# Altium schematic sheet DIAL_Sheet.SchDoc
size 420 x 297 mm; SheetNumber: 7; SheetTotal: 12
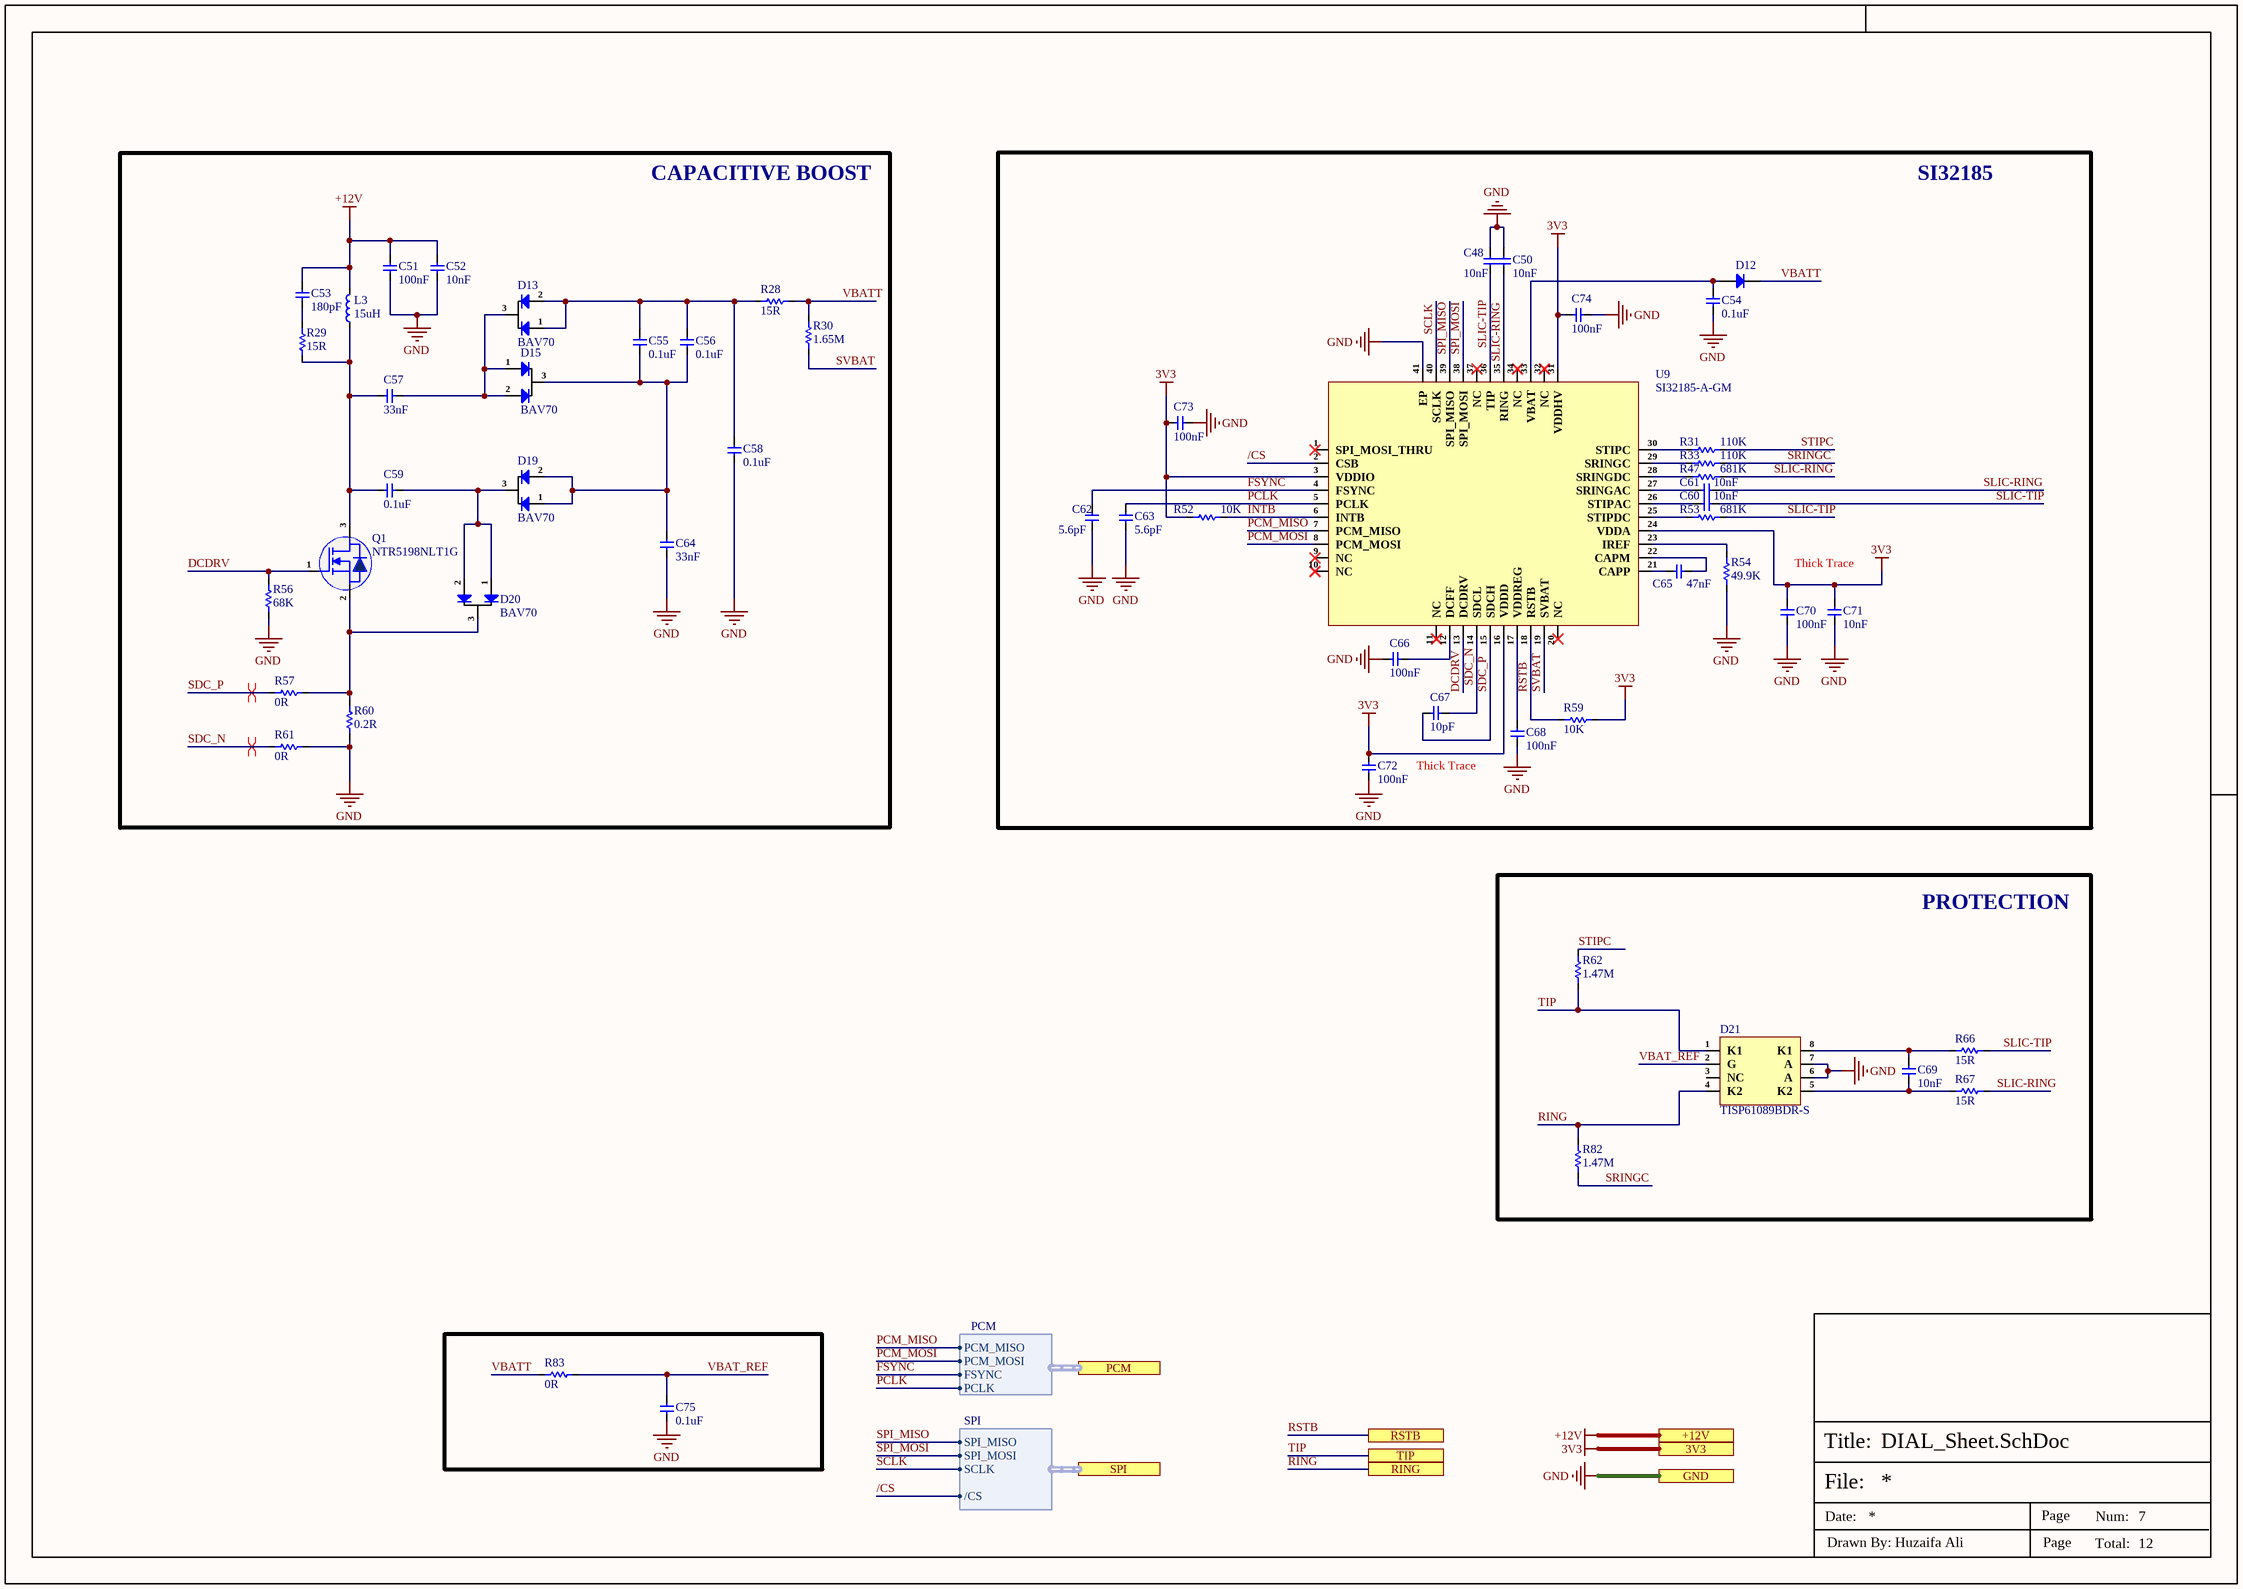
[diagram p0: DIAL_Sheet.SchDoc]

## Parts
C48  10nF  [Cap-0402]
C50  10nF  [Cap-0402]
C51  100nF  [CAP-0201]
C52  10nF  [Cap-0402]
C53  180pF  [CAP-0201]
C54  0.1uF  [Cap-0402]
C55  0.1uF  [Cap-0603]
C56  0.1uF  [Cap-0603]
C57  33nF  [Cap-0805]
C58  0.1uF  [Cap-0805]
C59  0.1uF  [Cap-0805]
C60  10nF  [Cap-0402]
C61  10nF  [Cap-0402]
C62  5.6pF  [Cap-0402]
C63  5.6pF  [Cap-0402]
C64  33nF  [Cap-0805]
C65  47nF  [Cap-0402]
C66  100nF  [CAP-0201]
C67  10pF  [Cap-0402]
C68  100nF  [CAP-0201]
C69  10nF  [Cap-0805]
C70  100nF  [CAP-0201]
C71  10nF  [Cap-0402]
C72  100nF  [CAP-0201]
C73  100nF  [CAP-0201]
C74  100nF  [CAP-0201]
C75  0.1uF  [Cap-0805]
D12  LBAS21HT1G  [SOD-323]  (value not drawn)
D13  BAV70  [SOT-23]
D15  BAV70  [SOT-23]
D19  BAV70  [SOT-23]
D20  BAV70  [SOT-23]
D21  TISP61089BDR-S  [SOIC-8(0.154", 3.90mm Width)]
L3  15uH  [VLS6045AF-150M]
Q1  NTR5198NLT1G  [SOT-23]
R28  15R  [Res-0603]
R29  15R  [Res-0603]
R30  1.65M  [RES-0805]
R31  110K  [Res-0603]
R33  110K  [Res-0603]
R47  681K  [Res-0603]
R52  10K  [Res-0201]
R53  681K  [Res-0603]
R54  49.9K  [Res-0402]
R56  68K  [RES-0603]
R57  0R  [Res-0603]
R59  10K  [Res-0201]
R60  0.2R  [Res-1206]
R61  0R  [Res-0603]
R62  1.47M  [Res-1206]
R66  15R  [Res-0603]
R67  15R  [Res-0603]
R82  1.47M  [Res-1206]
R83  0R  [Res-0603]
U9  SI32185-A-GM  [40-QFN (6x6)]

## Blocks framed on the sheet
CAPACITIVE BOOST: C51-C53 C55-C59 C64 D13 D15 D19 D20 L3 Q1 R28-R30 R56 R57 R60 R61
SI32185: C48 C50 C54 C60-C63 C65-C68 C70-C74 D12 R31 R33 R47 R52-R54 R59 U9
PROTECTION: C69 D21 R62 R66 R67 R82

## Ports
3V3, +12V, GND, PCM (harness PCM), RING, RSTB, SPI (harness SPI), TIP

## Harnesses
SPI: SPI_MISO, SPI_MOSI, SCLK, /CS
PCM: PCM_MISO, PCM_MOSI, FSYNC, PCLK

## Nets
3V3: C70.2 C71.2 C72.2 C73.2 C74.2 R52.1 R59.1 U9.3(VDDIO) U9.16(VDDD) U9.24(VDDA) U9.31(VDDHV) ; port 3V3
+12V: C51.2 C52.2 C53.2 L3.2 ; port +12V
GND: C48.2 C50.2 C51.1 C52.1 C54.2 C58.1 C62.1 C63.1 C64.1 C66.1 C68.1 C70.1 C71.1 C72.1 C73.1 C74.1 C75.1 D21.6(A) D21.7(A) R54.1 R56.1 R60.1 R61.2 U9.41(EP) ; port GND
/CS: U9.2(CSB) ; port SPI./CS
DCDRV: Q1.1(G) R56.2 U9.13(DCDRV)
FSYNC: C62.2 U9.4(FSYNC) ; port PCM.FSYNC
INTB: R52.2 U9.6(INTB)
PCLK: C63.2 U9.5(PCLK) ; port PCM.PCLK
PCM_MISO: U9.7(PCM_MISO) ; port PCM.PCM_MISO
PCM_MOSI: U9.8(PCM_MOSI) ; port PCM.PCM_MOSI
RING: D21.4(K2) R82.2 ; port RING
RSTB: R59.2 U9.18(RSTB) ; port RSTB
SCLK: U9.40(SCLK) ; port SPI.SCLK
SDC_N: C67.2 R61.1 U9.14(SDCL)
SDC_P: C67.1 R57.1 U9.15(SDCH)
SLIC-RING: C50.1 C61.1 R47.2 R67.2 U9.35(RING)
SLIC-TIP: C48.1 C60.1 R53.2 R66.2 U9.36(TIP)
SPI_MISO: U9.39(SPI_MISO) ; port SPI.SPI_MISO
SPI_MOSI: U9.38(SPI_MOSI) ; port SPI.SPI_MOSI
SRINGC: R33.2 R82.1
STIPC: R31.2 R62.2
SVBAT: R30.1 U9.19(SVBAT)
TIP: D21.1(K1) R62.1 ; port TIP
VBAT_REF: C75.2 D21.2(G) R83.2
VBATT: D12.1(K) R28.2 R30.2 R83.1
NetC53_1: C53.1 R29.2
NetC54_1: C54.1 D12.2(A) U9.33(VBAT)
NetC55_1: C55.1 C56.1 C64.2 D15.3 D19.1 D19.2
NetC55_2: C55.2 C56.2 C58.2 D13.1 D13.2 R28.1
NetC57_1: C57.1 C59.1 L3.1 Q1.3(D) R29.1
NetC57_2: C57.2 D13.3 D15.1 D15.2
NetC59_2: C59.2 D19.3 D20.1 D20.2
NetC60_2: C60.2 U9.26(STIPAC)
NetC61_2: C61.2 U9.27(SRINGAC)
NetC65_1: C65.1 U9.21(CAPP)
NetC65_2: C65.2 U9.22(CAPM)
NetC66_2: C66.2 U9.12(DCFF)
NetC68_2: C68.2 U9.17(VDDREG)
NetC69_1: C69.1 D21.5(K2) R67.1
NetC69_2: C69.2 D21.8(K1) R66.1
NetD20_3: D20.3 Q1.2(S) R57.2 R60.2
NetR31_1: R31.1 U9.30(STIPC)
NetR33_1: R33.1 U9.29(SRINGC)
NetR47_1: R47.1 U9.28(SRINGDC)
NetR53_1: R53.1 U9.25(STIPDC)
NetR54_2: R54.2 U9.23(IREF)

Not connected (* = marked no-connect by the designer): D21 3(NC); U9 1(SPI_MOSI_THRU)* 9(NC)* 10(NC)* 11(NC)* 20(NC)* 32(NC)* 34(NC)* 37(NC)*

## Layout directives
differential pair; net class SDC; differential pair class SDC_LINES: SDC_N, SDC_P

## Notes on the sheet
- Thick Trace
- File:
- Title:
- Date:
- Page
- Num:
- Total:
- Drawn By: Huzaifa Ali

## Library data of the parts
C48 C50 C52 C60 C61 C71 = GCM155R71H103JA55D: CAP CER 10000PF 50V X7R 0402; Manufacturer: Murata; Tolerance: 5%; Item Type: Capacitor; Supplier: Digikey; Supplier Part Number: 490-14352-2-ND; Manufacturer Part Number: GCM155R71H103JA55D; RoHS: Yes; Category: Ceramic Capacitors; Mounting Technology: Surface Mount; Case/Package: 0402; Case Code (Imperial): 0402; Case Code (Metric): 1005; Min Operating Temperature: -55°C; Max Operating Temperature: 125°C; Packaging: Cut Tape; Value: 10nF; Voltage Rating: 50V; Series: GCM; Ratings: AEC-Q200; RoHS Compliant: Yes; ComponentLink1URL: http://search.murata.co.jp/Ceramy/image/img/A01X/partnumbering_e_02.pdf?src-supplier=Digikey; ComponentLink1Description: http://search.murata.co.jp/Ceramy/image/img/A01X/partnumbering_e_02.pdf?src-supplier=Digikey; ComponentLink2URL: http://search.murata.co.jp/Ceramy/image/img/A01X/G101/ENG/GCM155R71H103JA55-01.pdf?src-supplier=Digikey; ComponentLink2Description: http://search.murata.co.jp/Ceramy/image/img/A01X/G101/ENG/GCM155R71H103JA55-01.pdf?src-supplier=Digikey; LCSC Part Number: C5189696
C51 C66 C68 C70 C72-C74 = CC0201KRX5R6BB104: CAP CER 0.1UF 10V X5R 0201; Manufacturer: Yageo; Tolerance: 10%; Supplier 1: Mouser; Manufacturer Part Number: CC0201KRX5R6BB104; RoHS: Yes; Category: Ceramic Capacitors; Stock 1: 824403; Pricing 1: 1=0.10000, 10=0.02400, 50=0.02400, 100=0.01900, 1000=0.01100, 10000=0.00900 (USD); Mount: Surface Mount; Case/Package: 0201; Case Code (Imperial): 0201; Case Code (Metric): 0603; Weight: 6E-06oz; Min Operating Temperature: -55°C; Max Operating Temperature: 85°C; Capacitance: 100nF; Dielectric: X5R; Voltage Rating (DC): 10V; Packaging: Tape and Reel; Termination: SMD/SMT; Resistor Type: Ceramic; Voltage Rating: 10V; Series: CC; Construction: Flat; Length: 0.6mm; Width: 0.012inch; Height: 0.3mm; Thickness: 0.013inch; Depth: 0.3mm; Radiation Hardening: No; Lead Free: Lead Free; Halogen Free: Halogen Free; RoHS Compliant: Yes; ComponentLink1URL: https://datasheet.ciiva.com/11587/upy-gphc-x5r-4v-to-50v-12-11587190.pdf?src-supplier=Avnet; ComponentLink1Description: https://datasheet.ciiva.com/11587/upy-gphc-x5r-4v-to-50v-12-11587190.pdf?src-supplier=Avnet; Supplier Part Number 1: 603-CC201KRX5R6BB104; LCSC Part Number: C190183
C53 = 0201B181J500CT: CAP CER 180PF 50V X7R 0201; Manufacturer: Walsin Technologies; Item Type: Capacitor; Supplier: Digikey; Supplier Part Number: 1292-0201B181J500CTTR-ND; Manufacturer Part Number: 0201B181J500CT; RoHS: Yes; Category: Ceramic Capacitors; Pricing: 15000=0.0101 (USD); RoHS Compliant: Yes; LCSC Part Number: C458606
C54 = C1005X5R1H104K050BB: CAP CER 0.1UF 50V X5R 0402; Manufacturer: TDK; Dielectric Material: Ceramic; Capacitance: 100nF; Tolerance: 10%; Item Type: Capacitor; Supplier 1: Digi-Key; Manufacturer Part Number: C1005X5R1H104K050BB; Stock 1: 1455182; Pricing 1: 1=0.12, 10=0.09, 50=0.049, 100=0.04, 500=0.02858, 1000=0.02245, 2500=0.02041, 5000=0.01878 (USD); Mount: Surface Mount; Case/Package: 0402; Case Code (Metric): 1005; Case Code (Imperial): 0402; Weight: 2.3E-05oz; Min Operating Temperature: -55°C; Max Operating Temperature: 85°C; Dielectric: X5R; Voltage Rating: 50V; Packaging: Tape and Reel; Voltage Rating (DC): 50V; Termination: SMD/SMT; Construction: Flat; Package Quantity: 1; Resistor Type: Ceramic; Voltage: 50V; Series: C; Length: 1mm; Width: 0.02inch; Height: 0.5mm; Depth: 0.5mm; Thickness: 0.022inch; Radiation Hardening: No; Lead Free: Lead Free; REACH SVHC: No SVHC; RoHS Compliant: Yes; ComponentLink1URL: https://product.tdk.com/info/en/catalog/spec/mlccspec_commercial_general_midvoltage_en.pdf?src-supplier=Digi-Key; ComponentLink1Description: https://product.tdk.com/info/en/catalog/spec/mlccspec_commercial_general_midvoltage_en.pdf?src-supplier=Digi-Key; ComponentLink2URL: http://www.tdk.co.jp/tefe02/e413_c.pdf?src-supplier=Future+Electronics; ComponentLink2Description: http://www.tdk.co.jp/tefe02/e413_c.pdf?src-supplier=Future+Electronics; ComponentLink3URL: https://www.verical.com/server-webapp/html/getDatasheet?partID=743571&src-supplier=Verical; ComponentLink3Description: https://www.verical.com/server-webapp/html/getDatasheet?partID=743571&src-supplier=Verical; ComponentLink4URL: http://www.tdk.co.jp/tefe02/e412_c.pdf?src-supplier=Avnet+Europe; ComponentLink4Description: http://www.tdk.co.jp/tefe02/e412_c.pdf?src-supplier=Avnet+Europe; Supplier Part Number 1: 445-5942-1-ND; LCSC Part Number: C2181865
C55 C56 = CC0603KRX7R0BB104: CAP CER 0.1UF 100V X7R 0603; Manufacturer: Yageo; Capacitance: 100nF; Tolerance: 10%; Item Type: Capacitor; Supplier 1: Digi-Key; Manufacturer Part Number: CC0603KRX7R0BB104; RoHS: Yes; Category: Ceramic Capacitors; Stock 1: 60476; Pricing 1: 1=0.19000, 10=0.13500, 50=0.07680, 100=0.06370, 500=0.04466, 1000=0.03696 (USD); Mount: Surface Mount; Case/Package: 0603; Case Code (Metric): 1608; Case Code (Imperial): 0603; Weight: 7.1E-05oz; Min Operating Temperature: -55°C; Max Operating Temperature: 125°C; Package Quantity: 4000; Voltage Rating: 100V; Packaging: Tape and Reel; Dielectric: X7R; Termination: SMD/SMT; Resistor Type: Ceramic; Voltage Rating (DC): 100V; Series: CC; Length: 0.063inch; Width: 0.031inch; Thickness: 0.035inch; Depth: 0.8mm; Lead Free: Lead Free; RoHS Compliant: Yes; ComponentLink1URL: https://datasheet.ciiva.com/6277/mlccorderingcode-6277030.pdf?src-supplier=Digi-Key; ComponentLink1Description: https://datasheet.ciiva.com/6277/mlccorderingcode-6277030.pdf?src-supplier=Digi-Key; ComponentLink2URL: https://datasheet.ciiva.com/6277/mlccorderingcode-6277081.pdf?src-supplier=Digi-Key; ComponentLink2Description: https://datasheet.ciiva.com/6277/mlccorderingcode-6277081.pdf?src-supplier=Digi-Key; ComponentLink3URL: https://datasheet.ciiva.com/6277/mlccorderingcode-6277082.pdf?src-supplier=Digi-Key; ComponentLink3Description: https://datasheet.ciiva.com/6277/mlccorderingcode-6277082.pdf?src-supplier=Digi-Key; Supplier Part Number 1: 311-1523-1-ND; LCSC Part Number: C113803
C57 C64 = HHV0805R7333K251NSLJ: 250V 33nF X7R 0805 Multilayer Ceramic Capacitors MLCC - SMD/SMT ROHS; Manufacturer: Chinocera; Manufacturer Part Number: HHV0805R7333K251NSLJ; Package: 0805; LCSC Part Number: C5186797; Item Type: Capacitor; ComponentLink1Description: LCSC; ComponentLink1URL: https://www.lcsc.com/product-detail/Multilayer-Ceramic-Capacitors-MLCC-SMD-SMT_Chinocera-HHV0805R7333K251NSLJ_C5186797.html
C58 C59 C75 = C2012X7T2E104KT000N: CAP CER 0.1UF 250V X7T 0805; Manufacturer: TDK Corporation; Manufacturer Part Number: C2012X7T2E104K125AA; Item Type: Capacitor; Package: 0805; LCSC Part Number: C342865; ComponentLink1Description: LCSC; ComponentLink1URL: https://www.lcsc.com/product-detail/Multilayer-Ceramic-Capacitors-MLCC-SMD-SMT_TDK-C2012X7T2E104KT000N_C342865.html
C62 C63 = CC0402BRNPO9BN5R6: CAP CER 5.6PF 50V C0G/NPO 0402; Manufacturer: Yageo; Item Type: Capacitor; Supplier: Future Electronics; Supplier Part Number: 3807997; Manufacturer Part Number: CC0402BRNPO9BN5R6; RoHS: Yes; Category: Ceramic Capacitors; Stock: 1840000; Pricing: 10000=0.0035, 40000=0.0031, 50000=0.0033, 150000=0.003, 250000=0.0031, 300000=0.0029, 500000=0.003, 750000=0.0027, 1500000=0.0028 (USD); Halogen Free: 5694HalogenFree; ComponentLink1URL: https://datasheet.ciiva.com/26829/getdatasheetpartid-403430-26829253.pdf?src-supplier=Verical; ComponentLink1Description: https://datasheet.ciiva.com/26829/getdatasheetpartid-403430-26829253.pdf?src-supplier=Verical; ComponentLink2URL: https://datasheet.ciiva.com/13265/upy-gp-np0-16v-to-50v-8-3714-13265516.pdf?src-supplier=Mouser; ComponentLink2Description: https://datasheet.ciiva.com/13265/upy-gp-np0-16v-to-50v-8-3714-13265516.pdf?src-supplier=Mouser; LCSC Part Number: C505468
C65 = CC0402KRX7R9BB473: CAP CER 0.047UF 50V X7R 0402; Manufacturer: Yageo; Material: 4241ConductorMaterial; Tolerance: 10%; Temperature Coefficient: 30ppm/°C; Dielectric: 1511DielectricType; Item Type: Capacitor; Supplier: Future Electronics; Supplier Part Number: 2095687; Manufacturer Part Number: CC0402KRX7R9BB473; RoHS: Yes; Category: Ceramic Capacitors; Stock: 1130000; Pricing: 10000=0.0044, 40000=0.0042, 100000=0.004, 150000=0.0041, 250000=0.0039, 400000=0.0037, 500000=0.0038 (USD); Mounting Technology: Surface Mount; Case/Package: 0402; Case Code (Imperial): 0402; Case Code (Metric): 1005; Min Operating Temperature: -55°C; Max Operating Temperature: 125°C; Packaging: Tape and Reel; Value: 47nF; Voltage Rating: 50V; Series: CC; Voltage Rating (DC): 50V; Length: 0.039inch; Width: 0.02inch; Height: 550um; Thickness: 0.022inch; RoHS Compliant: Yes; Halogen Free: 5694HalogenFree; Lead Free: 5697LeadFree; ComponentLink1URL: https://datasheet.octopart.com/CC0402KRX7R9BB473-Yageo-datasheet-166511530.pdf?src-supplier=Future+Electronics; ComponentLink1Description: https://datasheet.octopart.com/CC0402KRX7R9BB473-Yageo-datasheet-166511530.pdf?src-supplier=Future+Electronics; ComponentLink2URL: http://www.yageo.com/documents/recent/UPY-GPHC_X7R_6.3V-to-50V_18.pdf?src-supplier=Digikey; ComponentLink2Description: http://www.yageo.com/documents/recent/UPY-GPHC_X7R_6.3V-to-50V_18.pdf?src-supplier=Digikey; ComponentLink3URL: https://datasheet.octopart.com/CC0402KRX7R9BB473-Yageo-datasheet-140260305.pdf?src-supplier=Newark; ComponentLink3Description: https://datasheet.octopart.com/CC0402KRX7R9BB473-Yageo-datasheet-140260305.pdf?src-supplier=Newark; LCSC Part Number: C272875
C67 = GRM1555C1H100JA01D: CAP CER 10PF 50V C0G/NP0 0402; Manufacturer: Murata; Material: Ceramic; Dielectric: C0G; Tolerance: 5%; Item Type: Capacitor; Supplier: Arrow Electronics; Supplier Part Number: GRM1555C1H100JA01D; Manufacturer Part Number: GRM1555C1H100JA01D; RoHS: Yes; Category: Ceramic Capacitors; Stock: 3860000; Pricing: 10000=0.0034, 50000=0.0027, 100000=0.0023, 250000=0.0021 (USD); Mounting Technology: Surface Mount; Case/Package: 0402; Case Code (Metric): 1005; Case Code (Imperial): 0402; Min Operating Temperature: -55°C; Max Operating Temperature: 125°C; Value: 10pF; Voltage Rating: 50V; Packaging: Tape and Reel; Package Quantity: 1; Voltage Rating (DC): 50V; Termination: SMD/SMT; Series: GRM; Voltage: 50V; Construction: Flat; Length: 1mm; Width: 0.02inch; Height: 0.5mm; Depth: 0.5mm; Thickness: 0.022inch; Radiation Hardening: No; RoHS Compliant: Yes; Lead Free: Lead Free; Reach SVHC Compliant: No; ComponentLink1URL: https://datasheet.ciiva.com/2989/product-2989280.pdf?src-supplier=Avnet; ComponentLink1Description: https://datasheet.ciiva.com/2989/product-2989280.pdf?src-supplier=Avnet; ComponentLink2URL: https://datasheet.ciiva.com/18184/getdatasheetpartid-307234-18184164.pdf?src-supplier=Verical; ComponentLink2Description: https://datasheet.ciiva.com/18184/getdatasheetpartid-307234-18184164.pdf?src-supplier=Verical; ComponentLink3URL: https://datasheet.ciiva.com/29200/453545-da-01-en-vs-kondensator-0402-29200107.pdf?src-supplier=Conrad; ComponentLink3Description: https://datasheet.ciiva.com/29200/453545-da-01-en-vs-kondensator-0402-29200107.pdf?src-supplier=Conrad; ComponentLink4URL: https://datasheet.ciiva.com/7828/1666664-7828812.pdf?src-supplier=Element14; ComponentLink4Description: https://datasheet.ciiva.com/7828/1666664-7828812.pdf?src-supplier=Element14; ComponentLink5URL: https://datasheet.ciiva.com/6271/partnumbering-e-01-6271159.pdf?src-supplier=Digi-Key; ComponentLink5Description: https://datasheet.ciiva.com/6271/partnumbering-e-01-6271159.pdf?src-supplier=Digi-Key; ComponentLink6URL: https://datasheet.ciiva.com/6271/partnumbering-e-01-6271158.pdf?src-supplier=Digi-Key; ComponentLink6Description: https://datasheet.ciiva.com/6271/partnumbering-e-01-6271158.pdf?src-supplier=Digi-Key; ComponentLink7URL: https://datasheet.ciiva.com/6271/partnumbering-e-01-6271068.pdf?src-supplier=Digi-Key; ComponentLink7Description: https://datasheet.ciiva.com/6271/partnumbering-e-01-6271068.pdf?src-supplier=Digi-Key; LCSC Part Number: C76946
C69 = 0805B103J201CT: CAP CER 10000PF 200V X7R 0805; Manufacturer: Walsin Technology Corporation; Item Type: Capacitor; Manufacturer Part Number: 0805B103J201CT; Package: 0805; LCSC Part Number: C5122275; ComponentLink1Description: LCSC; ComponentLink1URL: https://www.lcsc.com/product-detail/Multilayer-Ceramic-Capacitors-MLCC-SMD-SMT_Walsin-Tech-Corp-0805B103J201CT_C5122275.html
D12 = LBAS21HT1G: 250V 200mW Single 1.25V 50ns 200mA SOD-323 Switching Diode ROHS; Manufacturer: LRC; Manufacturer Part Number: LBAS21HT1G; Package: SOD-323; LCSC Part Number: C12742; Item Type: Diode; ComponentLink1Description: LCSC; ComponentLink1URL: https://www.lcsc.com/product-detail/Switching-Diode_LRC-LBAS21HT1G_C12742.html
D13 D15 D19 D20 = BAV70: 70V 225mW Dual Common Cathode 1.25V@150mA 6ns 200mA SOT-23 Switching Diode ROHS; Manufacturer: TWGMC; Manufacturer Part Number: BAV70; Package: SOT-23; LCSC Part Number: C727123; Item Type: Diode; ComponentLink1Description: LCSC; ComponentLink1URL: https://www.lcsc.com/product-detail/Switching-Diode_TWGMC-BAV70_C727123.html
D21 = TISP61089BDR-S: THYRISTOR 170V 30A 8SOIC; Manufacturer: Bourns; Number of Elements: 2; Value: 100pF; Forward Voltage: 3V; Hold Current: 150mA; Current Rating: -5uA; Item Type: (TVS/ESD); Supplier: Digikey; Supplier Part Number: TISP61089BDR-SCT-ND; Manufacturer Part Number: TISP61089BDR-S; RoHS: Yes; Category: TRIACs; Stock: 22616; Pricing: 1=1.38, 10=1.129, 100=0.8781, 500=0.74428, 1000=0.6063 (USD); Mounting Technology: Surface Mount; Case/Package: SOIC; Pins: 8; Weight: 0.004762oz; Min Operating Temperature: -40°C; Max Operating Temperature: 85°C; Packaging: Tape and Reel; Package Quantity: 2500; Max Repetitive Reverse Voltage (Vrrm): 170V; Number of Circuits: 2; Peak Pulse Current: 30A; Operating Supply Voltage: 3V; Series: -; Length: 5mm; Width: 4mm; Height: 1.55mm; Radiation Hardening: No; Reach SVHC Compliant: No; Lead Free: Lead Free; RoHS Compliant: Yes; ComponentLink1URL: https://datasheet.ciiva.com/30076/tisp61089b-30076825.pdf?src-supplier=Onlinecomponents.com; ComponentLink1Description: https://datasheet.ciiva.com/30076/tisp61089b-30076825.pdf?src-supplier=Onlinecomponents.com; ComponentLink2URL: https://datasheet.ciiva.com/46364/2035135-46364842.pdf?src-supplier=Jameco; ComponentLink2Description: https://datasheet.ciiva.com/46364/2035135-46364842.pdf?src-supplier=Jameco; ComponentLink3URL: https://datasheet.ciiva.com/4744/tisp61089b-75813-4744776.pdf?src-supplier=Mouser; ComponentLink3Description: https://datasheet.ciiva.com/4744/tisp61089b-75813-4744776.pdf?src-supplier=Mouser; ComponentLink4URL: https://datasheet.ciiva.com/362/tisp61089b-362311.pdf?src-supplier=Digikey; ComponentLink4Description: https://datasheet.ciiva.com/362/tisp61089b-362311.pdf?src-supplier=Digikey; LCSC Part Number: C415877
L3 = VLS6045AF-150M: FIXED IND 15UH 2.8A 77 MOHM SMD; Manufacturer: TDK; Core Material: Ferrite; Tolerance: 20%; Saturation Current: 2.5A; Shielding: Shielded; DC Resistance (DCR): 77mR; Test Frequency: 100kHz; Item Type: Inductor; Supplier: Mouser; Supplier Part Number: 810-VLS6045AF-150M; Manufacturer Part Number: VLS6045AF-150M; RoHS: Yes; Category: Fixed Inductors; Stock: 1988; Pricing: 1=0.44, 10=0.415, 50=0.415, 100=0.3, 1000=0.204, 10000=0.185 (USD); Mounting Technology: Surface Mount; Case/Package: Nonstandard; Min Operating Temperature: -40°C; Max Operating Temperature: 105°C; Series: VLS; Packaging: Cut Tape; Value: 15uH; RoHS Compliant: Yes; ComponentLink1URL: https://product.tdk.com/info/en/catalog/datasheets/inductor_commercial_power_vls6045af_en.pdf?src-supplier=Digi-Key; ComponentLink1Description: https://product.tdk.com/info/en/catalog/datasheets/inductor_commercial_power_vls6045af_en.pdf?src-supplier=Digi-Key; LCSC Part Number: C2043078
Q1 = NTR5198NLT1G: SOT-23 MOSFETs ROHS; Manufacturer: TECH PUBLIC; Item Type: MOSFET; Manufacturer Part Number: NTR5198NLT1G; Package: SOT-23; LCSC Part Number: C5122029; ComponentLink1Description: LCSC; ComponentLink1URL: https://www.lcsc.com/product-detail/MOSFETs_TECH-PUBLIC-NTR5198NLT1G_C5122029.html
R28 R29 R66 R67 = RC0603FR-0715RL: RES 15 OHM 1% 1/10W 0603; Manufacturer: Yageo; Voltage Rating (AC): 50V; Current Rating: 50mA; Item Type: Resistor; Supplier: Future Electronics; Supplier Part Number: 6308514; Manufacturer Part Number: RC0603FR-0715RL; RoHS: Yes; Category: Chip SMD Resistors; Stock: 5830000; Pricing: 5000=0.0011, 75000=0.001, 200000=0.001, 500000=0.001, 1250000=0.0009 (USD); Weight: 250mg; Contact Material: 157ConductorMaterial; Lead Free: 5697LeadFree; ComponentLink1URL: https://datasheet.ciiva.com/5989/1686128-5989704.pdf?src-supplier=Farnell; ComponentLink1Description: https://datasheet.ciiva.com/5989/1686128-5989704.pdf?src-supplier=Farnell; ComponentLink2URL: https://datasheet.ciiva.com/8890/pyu-rc0603-51-rohs-l-4-8890742.pdf?src-supplier=Avnet; ComponentLink2Description: https://datasheet.ciiva.com/8890/pyu-rc0603-51-rohs-l-4-8890742.pdf?src-supplier=Avnet; ComponentLink3URL: https://datasheet.ciiva.com/12557/rc0603-272842-12557839.pdf?src-supplier=Mouser; ComponentLink3Description: https://datasheet.ciiva.com/12557/rc0603-272842-12557839.pdf?src-supplier=Mouser; ComponentLink4URL: https://datasheet.ciiva.com/2454/pyu-r-int-thick-7-2454840.pdf?src-supplier=Digikey; ComponentLink4Description: https://datasheet.ciiva.com/2454/pyu-r-int-thick-7-2454840.pdf?src-supplier=Digikey; ComponentLink5URL: https://datasheet.ciiva.com/2454/pyu-r-int-thick-7-2454841.pdf?src-supplier=Digikey; ComponentLink5Description: https://datasheet.ciiva.com/2454/pyu-r-int-thick-7-2454841.pdf?src-supplier=Digikey; ComponentLink6URL: https://datasheet.ciiva.com/2454/pyu-r-int-thick-7-2454842.pdf?src-supplier=Digikey; ComponentLink6Description: https://datasheet.ciiva.com/2454/pyu-r-int-thick-7-2454842.pdf?src-supplier=Digikey; ComponentLink7URL: https://datasheet.ciiva.com/7746/443971-7746262.pdf?src-supplier=Element14; ComponentLink7Description: https://datasheet.ciiva.com/7746/443971-7746262.pdf?src-supplier=Element14; ComponentLink8URL: https://datasheet.ciiva.com/7746/443971-7746263.pdf?src-supplier=Element14; ComponentLink8Description: https://datasheet.ciiva.com/7746/443971-7746263.pdf?src-supplier=Element14; LCSC Part Number: C128059
R30 = SCR0805F1M65: 125mW Thick Film Resistors 150V ±1% 1.65MΩ 0805 Chip Resistor - Surface Mount ROHS; Manufacturer: VO; Manufacturer Part Number: SCR0805F1M65; Package: 0805; LCSC Part Number: C3016615; Item Type: Resistor; ComponentLink1Description: LCSC; ComponentLink1URL: https://www.lcsc.com/product-detail/Chip-Resistor-Surface-Mount_VO-SCR0805F1M65_C3016615.html
R31 R33 = 0603WAD1103T5E: 110kΩ 0603 Chip Resistor - Surface Mount ROHS; Manufacturer: UNI-ROYAL; ComponentLink1Description: LCSC; ComponentLink1URL: https://www.lcsc.com/product-detail/Chip-Resistor-Surface-Mount_UNI-ROYAL-Uniroyal-Elec-0603WAD1103T5E_C423090.html; Manufacturer Part Number: 0603WAD1103T5E; Value: 110K; Footprint: 0603; LCSC Part Number: C423090; Item Type: Resistor
R47 R53 = RT0603BRD07681KL: RES SMD 681K OHM 0.1% 1/10W 0603; Manufacturer: Yageo; Value: 681kR; Power Rating: 100mW; Voltage Rating: 75V; Temperature Coefficient: 25ppm/°C; Item Type: Resistor; Supplier 1: Mouser; Manufacturer Part Number: RT0603BRD07681KL; RoHS: Yes; Category: Chip SMD Resistors; Stock 1: 6293; Pricing 1: 1=0.30000, 10=0.25300, 50=0.25300, 100=0.09900, 1000=0.04200, 10000=0.03400 (USD); Case/Package: 0603; Case Code (Imperial): 0603; Case Code (Metric): 1608; Weight: 7.1E-05oz; Min Operating Temperature: -55°C; Max Operating Temperature: 155°C; Packaging: Tape and Reel; Tolerance: 0.1%; Resistor Type: Thin Film; Number of Terminations: 2; Termination: SMD/SMT; Max Power Dissipation: 100mW; Features: Moisture Resistant; Series: RT; Length: 0.063inch; Width: 0.031inch; Height: 0.022inch; RoHS Compliant: Yes; ComponentLink1URL: https://datasheet.ciiva.com/12800/pyu-rt-1-to-0-05-rohs-l-4-12800173.pdf?src-supplier=Mouser; ComponentLink1Description: https://datasheet.ciiva.com/12800/pyu-rt-1-to-0-05-rohs-l-4-12800173.pdf?src-supplier=Mouser; Supplier Part Number 1: 603-RT0603BRD07681KL; LCSC Part Number: C861520
R52 R59 = RC0201FR-0710KL: RES SMD 10K OHM 1% 1/20W 0201; Manufacturer: Yageo; Item Type: Resistor; Manufacturer Part Number: RC0201FR-0710KL; Package: 0201; ComponentLink7Description: LCSC; ComponentLink7URL: https://www.lcsc.com/product-detail/Chip-Resistor-Surface-Mount_YAGEO-RC0201FR-0710KL_C106225.html; LCSC Part Number: C106225
R54 = RC0402FR-0749K9L: RES 49.9K OHM 1% 1/16W 0402; Manufacturer: Yageo; Power Rating: 62.5mW; Value: 49.9kR; Voltage Rating: 50V; Temperature Coefficient: 100ppm/°C; Max Power Dissipation: 63mW; Item Type: Resistor; Supplier: Digikey; Supplier Part Number: 311-49.9KLRCT-ND; Manufacturer Part Number: RC0402FR-0749K9L; RoHS: Yes; Category: Chip SMD Resistors; Stock: 5084418; Pricing: 1=0.1, 10=0.015, 50=0.0088, 100=0.0073, 500=0.00488, 1000=0.00417, 5000=0.00297 (USD); Case/Package: 0402; Case Code (Imperial): 0402; Case Code (Metric): 1005; Min Operating Temperature: -55°C; Max Operating Temperature: 155°C; Tolerance: 1%; Packaging: Tape and Reel; Termination: SMD/SMT; Voltage Rating (DC): 50V; Features: Moisture Resistant; Series: RC; Number of Terminations: 2; Construction: Rectangular; Length: 1mm; Depth: 0.5mm; RoHS Compliant: Yes; Military Standard: Not; Lead Free: Lead Free; ComponentLink1URL: https://datasheet.ciiva.com/17071/pyu-rc0402-51-rohs-l-6-r-17071066.pdf?src-supplier=Future+Electronics; ComponentLink1Description: https://datasheet.ciiva.com/17071/pyu-rc0402-51-rohs-l-6-r-17071066.pdf?src-supplier=Future+Electronics; LCSC Part Number: C137969
R56 = 0603WAF6802T5E: 100mW Thick Film Resistors 75V ±100ppm/℃ ±1% 68kΩ 0603 Chip Resistor - Surface Mount ROHS; Manufacturer: UNI-ROYAL(Uniroyal Elec); Manufacturer Part Number: 0603WAF6802T5E; Package: 0603; ComponentLink1Description: LCSC; ComponentLink1URL: https://www.lcsc.com/product-detail/Chip-Resistor-Surface-Mount_UNI-ROYAL-Uniroyal-Elec-0603WAF6802T5E_C23231.html; LCSC Part Number: C23231; Item Type: Resistor
R57 R61 R83 = RC0603JR-070RL: RES 0 OHM JUMPER 1/10W 0603; Manufacturer: Yageo; Resistance: 0mR; Tolerance: 1%; Power Rating: 100mW; Voltage Rating (DC): 50V; Temperature Coefficient: 200ppm/°C; Resistance Tolerance: 5%; Item Type: Resistor; Supplier 1: Digi-Key; Manufacturer Part Number: RC0603JR-070RL; RoHS: Yes; Category: Chip SMD Resistors; Stock 1: 18081776; Pricing 1: 1=0.10000, 10=0.01700, 25=0.01240, 50=0.00960, 100=0.00700, 250=0.00536, 500=0.00430, 1000=0.00316 (USD); Case/Package: 0603; Number of Pins: 2; Contact Plating: Tin,Matte; Case Code (Imperial): 0603; Case Code (Metric): 1608; Size Code: 0603; Min Operating Temperature: -55°C; Max Operating Temperature: 155°C; Resistor Type: Thick Film; Packaging: Tape and Reel; Termination: SMD/SMT; Series: RC; Technology: THICK FILM; Package Quantity: 5000; Voltage Rating: 50V; Features: Moisture Resistant; Max Power Dissipation: 100mW; Number of Terminations: 2; Construction: Rectangular; Length: 1.6mm; Width: 0.8mm; Height: 0.45mm; Depth: 0.8mm; Radiation Hardening: No; Reach SVHC Compliant: No SVHC; Lead Free: Lead Free; RoHS Compliant: Yes; Military Standard: Not; Supplier Part Number 1: 311-0.0GRCT-ND; LCSC Part Number: C95177
R60 = PT1206FR-7W0R2L: RES 0.2 OHM 1% 1/2W 1206; Manufacturer: Yageo; Value: 200mR; Max Power Dissipation: 500mW; Temperature Coefficient: 75ppm/°C; Item Type: Resistor; Supplier: Rs; Supplier Part Number: 1996026P; Manufacturer Part Number: PT1206FR-7W0R2L; RoHS: Yes; Category: Chip SMD Resistors; Stock: 1100; Pricing: 100=0.134, 250=0.125, 500=0.117, 1000=0.106 (GBP); Case/Package: 1206; Min Operating Temperature: -55°C; Max Operating Temperature: 155°C; Packaging: Tape and Reel; Number of Terminations: 2; Tolerance: 1%; Features: Moisture Resistant,Automotive AEC-Q200; Series: PT; Length: 0.122inch; Width: 0.063inch; Height: 0.026inch; ComponentLink1URL: http://www.mouser.com/ds/2/447/yageodocoutput-1101729.pdf?src-supplier=Mouser; ComponentLink1Description: http://www.mouser.com/ds/2/447/yageodocoutput-1101729.pdf?src-supplier=Mouser; ComponentLink2URL: http://www.yageo.com/exep/pages/download/literatures/R-chip_current%20sensor_20140512.pdf?src-supplier=Digikey; ComponentLink2Description: http://www.yageo.com/exep/pages/download/literatures/R-chip_current%20sensor_20140512.pdf?src-supplier=Digikey; LCSC Part Number: C309533
R62 R82 = FRC1206F1474TS: 250mW Thick Film Resistors 200V ±100ppm/℃ ±1% 1.47MΩ 1206 Chip Resistor - Surface Mount ROHS; Manufacturer: FOJAN; Manufacturer Part Number: FRC1206F1474TS; Package: 1206; LCSC Part Number: C5126193; Item Type: Resistor; ComponentLink1Description: LCSC; ComponentLink1URL: https://www.lcsc.com/product-detail/Chip-Resistor-Surface-Mount_FOJAN-FRC1206F1474TS_C5126193.html
U9 = SI32185-A-GM: IC TELECOM INTERFACE 40QFN; Manufacturer: Skyworks Solutions; Supplier: Digikey; Supplier Part Number: 336-5396-ND; Manufacturer Part Number: SI32185-A-GM; RoHS: No; Category: Uncategorized; Stock: 2912; Pricing: 1=7.24, 10=6.536, 25=6.2324, 80=5.41138, 364=5.16816, 728=4.71216, 1092=4.10414 (USD); Item Type: IC